# Altium project POWER BOARD.PrjPcb
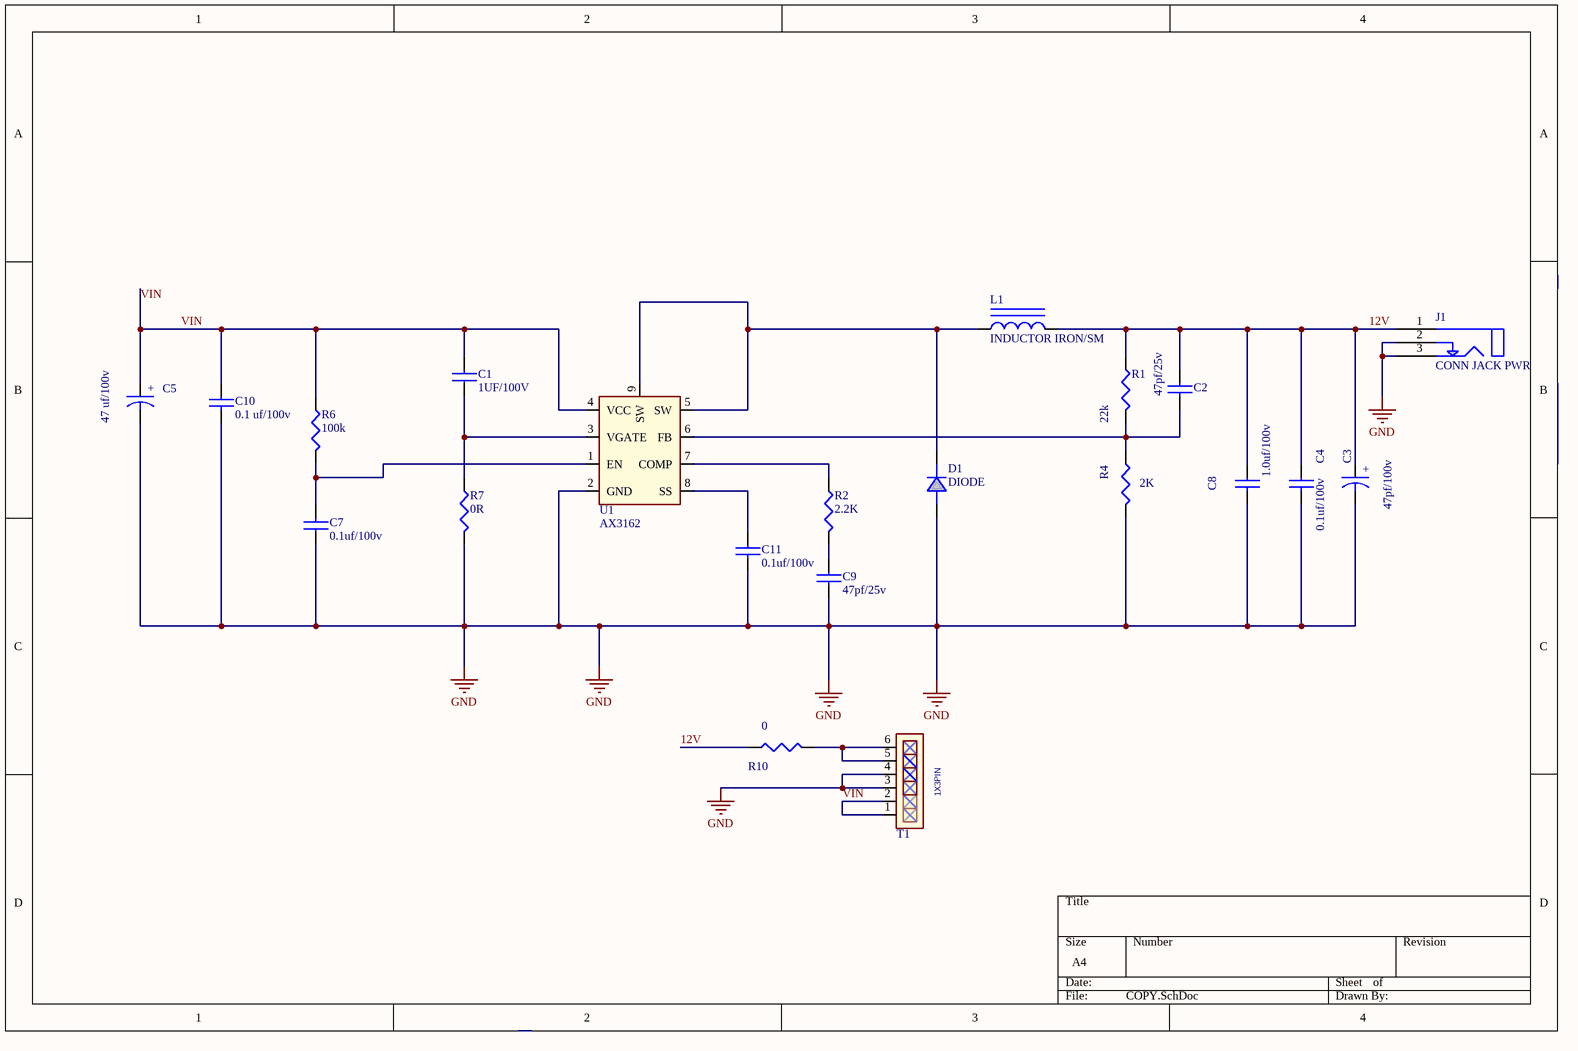
[diagram p0: COPY.SchDoc]
1 sheet, 21 parts. Net scope: global (net labels, ports and power ports of the same name join across sheets).
Board files: COPY.PcbDoc, PCB2.PcbDoc

## Sheet COPY.SchDoc
size A4

### Parts
C1  1UF/100V  [C_0805]
C2  47pf/25v  [C_0805]
C3  47pf/100v  [CAP_ALLU 2.5mm]
C4  0.1uf/100v  [C_0805]
C5  47 uf/100v  [CAP_ALLU 3.5mm]
C7  0.1uf/100v  [C_0805]
C8  1.0uf/100v  [C_0805]
C9  47pf/25v  [C_0805]
C10  0.1 uf/100v  [C_0603]
C11  0.1uf/100v  [C_0805]
D1  DIODE  [Diode_SMB]
J1  CONN JACK PWR  [DC Power Socket]
L1  INDUCTOR IRON/SM  [Inductor]
R1  22k  [R_0805]
R2  2.2K  [R_0805]
R4  2K  [R_0805]
R6  100k  [R_0805]
R7  0R  [R_0805]
R10  0  [R_0603]
T1  1X3PIN  [HDR1X6_2.54mm]
U1  AX3162  [SO8E]

### Nets
GND: C3.2 C4.2 C5.2 C7.1 C8.2 C9.2 C10.2 C11.2 D1.2(A) J1.2 J1.3 R4.2 R7.2 T1.3 T1.4 U1.2(GND)
12V: C2.1 C3.1 C4.1 C8.1 J1.1 L1.2 R1.1 R10.1
VIN: C1.2 C5.1 C10.1 R6.1 T1.1 T1.2 U1.4(VCC)
NetC1_1: C1.1 R7.1 U1.3(VGATE)
NetC2_2: C2.2 R1.2 R4.1 U1.6(FB)
NetC7_2: C7.2 R6.2 U1.1(EN)
NetC9_1: C9.1 R2.2
NetC11_1: C11.1 U1.8(SS)
NetD1_1: D1.1(K) L1.1 U1.5(SW) U1.9(SW)
NetR2_1: R2.1 U1.7(COMP)
NetR10_2: R10.2 T1.5 T1.6

### Notes on the sheet
- (in symbol CAP) +

### Library data of the parts
C1 C2 C4 C7-C11 = C0603: Mount Status: Surface Mount; RoHS Compliant: Yes
  C10: Voltage: 0.1 uf/100v
C3 C5 = CAP
R1 R2 R4 R6 R7 R10 = RESISTOR